# Altium schematic sheet Power_Supplies.SchDoc: =DocumentName
size A4; DocumentNumber: 1; Revision: 0; SheetNumber: 2; SheetTotal: 30
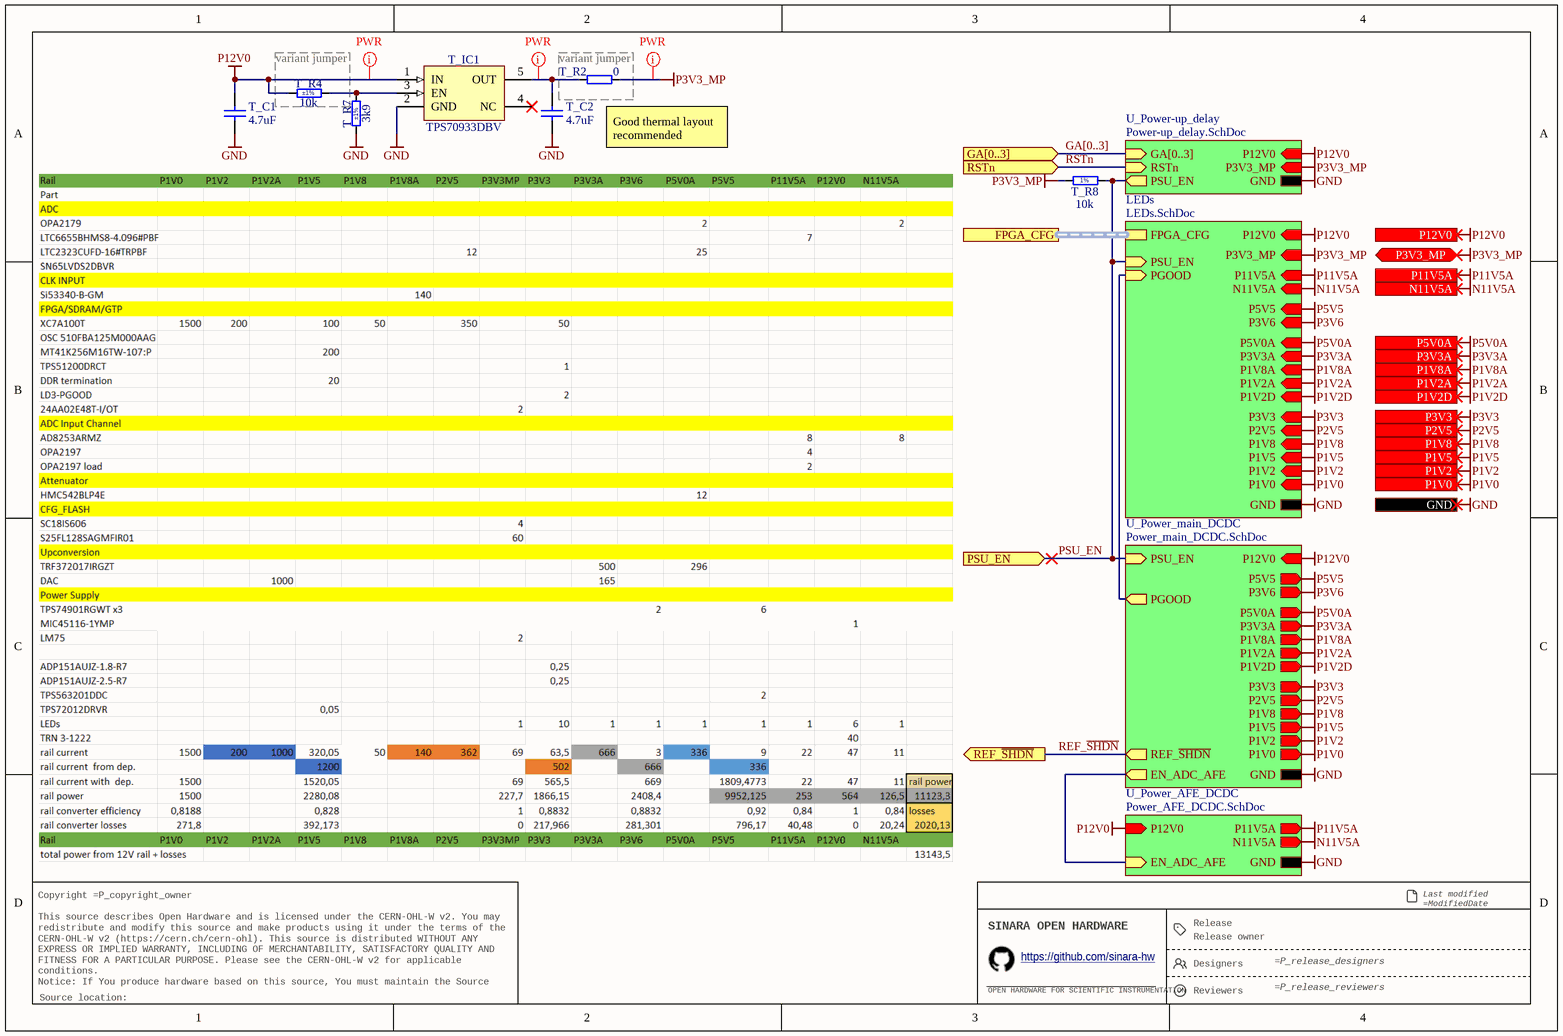
[diagram p0: Power_Supplies.SchDoc]

## Parts
T_C1  4.7uF  [CAPC2012X135N]
T_C2  4.7uF  [CAPC2012X135N]
T_IC1  TPS70933DBV  [SOT95P280X145-5N]
T_R2  0  [RESC1005X40N]
T_R4  10k  Tolerance: ±1%  [RESC1005X40N]
T_R7  3k9  Tolerance: ±1%  [RESC1005X40N]
T_R8  10k  [RESC1005X40N]

## Blocks framed on the sheet
variant jumper: T_R4
variant jumper: T_R2

## Sub-sheets
LEDs = LEDs.SchDoc: PSU_EN (in), PGOOD (in), P3V3_MP (in), P12V0 (in), FPGA_CFG (harness FPGA_CFG), P11V5A (in), N11V5A (in), GND, P5V0A (in), P3V3A (in), P1V8A (in), P1V2A (in), P1V2D (in), P3V3 (in), P2V5 (in), P1V8 (in), P1V5 (in), P1V2 (in), P1V0 (in), P5V5 (in), P3V6 (in)
U_Power-up_delay = Power-up_delay.SchDoc: GA[0..3] (in), RSTn (in), GND, PSU_EN (out), P3V3_MP (in), P12V0 (in)
U_Power_AFE_DCDC = Power_AFE_DCDC.SchDoc: P12V0 (in), P11V5A (out), GND, EN_ADC_AFE (in), N11V5A (out)
U_Power_main_DCDC = Power_main_DCDC.SchDoc: P12V0 (in), P5V0A (out), GND, PSU_EN (in), PGOOD (out), EN_ADC_AFE (out), REF_~{SHDN} (out), P3V3A (out), P1V8A (out), P1V2A (out), P1V2D (out), P3V3 (out), P2V5 (out), P1V8 (out), P1V5 (out), P1V2 (out), P1V0 (out), P5V5 (out), P3V6 (out)

## Ports
FPGA_CFG (harness FPGA_CFG), GA[0..3] (in), GND, N11V5A (out), P1V0 (out), P1V2 (out), P1V2A (out), P1V2D (out), P1V5 (out), P1V8 (out), P1V8A (out), P2V5 (out), P3V3 (out), P3V3_MP (bidir), P3V3A (out), P5V0A (out), P11V5A (out), P12V0 (in), PSU_EN (in), REF_~{SHDN} (out), RSTn (in)

## Nets
GND: T_C1.1 T_C2.1 T_IC1.2(GND) T_R7.1 ; port GND, sheet U_Power-up_delay/GND, sheet U_Power_main_DCDC/GND, sheet LEDs/GND, sheet U_Power_AFE_DCDC/GND
N11V5A: port N11V5A, sheet LEDs/N11V5A, sheet U_Power_AFE_DCDC/N11V5A
P1V0: port P1V0, sheet U_Power_main_DCDC/P1V0, sheet LEDs/P1V0
P1V2: port P1V2, sheet U_Power_main_DCDC/P1V2, sheet LEDs/P1V2
P1V2A: port P1V2A, sheet U_Power_main_DCDC/P1V2A, sheet LEDs/P1V2A
P1V2D: port P1V2D, sheet U_Power_main_DCDC/P1V2D, sheet LEDs/P1V2D
P1V5: port P1V5, sheet U_Power_main_DCDC/P1V5, sheet LEDs/P1V5
P1V8: port P1V8, sheet U_Power_main_DCDC/P1V8, sheet LEDs/P1V8
P1V8A: port P1V8A, sheet U_Power_main_DCDC/P1V8A, sheet LEDs/P1V8A
P2V5: port P2V5, sheet U_Power_main_DCDC/P2V5, sheet LEDs/P2V5
P3V3: port P3V3, sheet U_Power_main_DCDC/P3V3, sheet LEDs/P3V3
P3V3_MP: T_R2.2 T_R8.2 ; port P3V3_MP, sheet U_Power-up_delay/P3V3_MP, sheet LEDs/P3V3_MP
P3V3A: port P3V3A, sheet U_Power_main_DCDC/P3V3A, sheet LEDs/P3V3A
P3V6: sheet U_Power_main_DCDC/P3V6, sheet LEDs/P3V6
P5V0A: port P5V0A, sheet U_Power_main_DCDC/P5V0A, sheet LEDs/P5V0A
P5V5: sheet U_Power_main_DCDC/P5V5, sheet LEDs/P5V5
P11V5A: port P11V5A, sheet LEDs/P11V5A, sheet U_Power_AFE_DCDC/P11V5A
P12V0: T_C1.2 T_IC1.1(IN) T_R4.1 ; port P12V0, sheet U_Power-up_delay/P12V0, sheet U_Power_main_DCDC/P12V0, sheet LEDs/P12V0, sheet U_Power_AFE_DCDC/P12V0
PSU_EN: T_R8.1 ; port PSU_EN, sheet U_Power-up_delay/PSU_EN, sheet U_Power_main_DCDC/PSU_EN, sheet LEDs/PSU_EN
REF_~{SHDN}: port REF_~{SHDN}, sheet U_Power_main_DCDC/REF_~{SHDN}
RSTn: port RSTn, sheet U_Power-up_delay/RSTn
NetT_C2_2: T_C2.2 T_IC1.5(OUT) T_R2.1
NetT_IC1_3: T_IC1.3(EN) T_R4.2 T_R7.2
(unnamed): sheet U_Power_main_DCDC/PGOOD, sheet LEDs/PGOOD
(unnamed): sheet U_Power_main_DCDC/EN_ADC_AFE, sheet U_Power_AFE_DCDC/EN_ADC_AFE

Not connected (* = marked no-connect by the designer): T_IC1 4(NC)*

## Buses and harness runs
bus GA[0..3] = port GA[0..3] = sheet U_Power-up_delay/GA[0..3]
harness port FPGA_CFG = sheet LEDs/FPGA_CFG

## Layout directives
net class PWR: NetT_C2_2, P3V3_MP, P12V0

## Notes on the sheet
- (near T_R2) Good thermal layout recommended
- Release
- Last modified =ModifiedDate
  Sheet =sheetnumber of =sheettotal · Size A4
- Copyright =P_copyright_owner
  This source describes Open Hardware and is licensed under the CERN-OHL-W v2. You may redistribute and modify this source and make products using it under the terms of the CERN-OHL-W v2 (https://cern.ch/cern-ohl). This source is distributed WITHOUT ANY EXPRESS OR IMPLIED WARRANTY, INCLUDING OF MERCHANTABILITY, SATISFACTORY QUALITY AND FITNESS FOR A PARTICULAR PURPOSE. Please see the CERN-OHL-W v2 for applicable conditions.
  Notice: If You produce hardware based on this source, You must maintain the Source Location visible on the product, its packaging or its documentation.
- SINARA OPEN HARDWARE
- OPEN HARDWARE FOR SCIENTIFIC INSTRUMENTATION
- https://github.com/sinara-hw
- Release owner
- Designers
- Reviewers
- Source location:
- (in symbol R0402_10K_1%_0.0625W_100PPM) 1%

## Library data of the parts
T_C1 T_C2 = CC0805_4.7UF_16V_10%_X7R: Non-polarised capacitor; Part Description: SMD Multilayer Chip Ceramic Capacitor; Manufacturer: GENERIC; Manufacturer1 Part Number: EMK212B7475KG-T; Voltage: 16V; TC: X7R; Tolerance: ±10%; Part Number: CC0805_4.7UF_16V_10%_X7R; Component Kind: Standard; Component Type: Standard; Pin Count: 2; Value: 4.7uF; Status: Preferred; Manufacturer Part Number: CC0805_4.7UF_16V_10%_X7R; Case: 0805; Mounted: Yes; Socket: No; SMD: Yes; Sense: No; Manufacturer1 Example: TAIYO YUDEN; Manufacturer1 ComponentHeight: 1.35mm; HelpURL: \\cern.ch\dfs\Applications\Altium\Datasheets\CC0805_X7R_TAIYO-YUDEN_HIGH-VALUE.pdf; Author: CERN DEM JLC; CreateDate: 16.09.2014; LatestRevisionDate: 16.09.2014
T_IC1 = TPS70933DBV: 150-mA, 30-V, 1-µA IQ Voltage Regulators with Enable; Part Description: 3.3V, 150-mA, 30-V, 1-µA IQ Voltage Regulators with Enable; Manufacturer: TEXAS INSTRUMENTS; PressFit: No; Bonding: No; Part Number: TPS70933DBV; Component Kind: Standard; Component Type: Standard; Device: TPS70933DBV; PackageDescription: SOT23, 0.95mm Pitch; 5 Pin, 1.60mm W X 2.90mm L X 1.45mm H body, IPC Medium Density; Manufacturer Part Number: TPS70933DBV; Pin Count: 5; Case: SOT23-5; Mounted: Yes; Socket: No; SMD: Yes; Sense: No; ComponentHeight: 1.45mm; HelpURL: \\cern.ch\dfs\Applications\Altium\Datasheets\TPS709.pdf; Author: CERN DEM JLC; CreateDate: 17.03.2011; LatestRevisionDate: 17.03.2011
T_R2 = R0402_0R_JUMPER: Resistor; Part Description: 1A (0.05R Max DC Resistance) Zero Ohm Jumper; Manufacturer: GENERIC; Manufacturer1 Part Number: 232270591001L; PressFit: No; Part Number: R0402_0R_JUMPER; Component Kind: Standard; Component Type: Standard; Pin Count: 2; Value: 0; Status: Not Recommended; Manufacturer Part Number: R0402_0R_JUMPER; Case: 0402; Mounted: Yes; Sense: No; Socket: No; SMD: Yes; Manufacturer1 Example: YAGEO PHYCOMP; Manufacturer1 ComponentHeight: 0.4mm; HelpURL: \\cern.ch\dfs\Applications\Altium\Datasheets\R0402_Phycomp_RC0402.pdf; Author: CERN DEM JLC; CreateDate: 03.12.2007; LatestRevisionDate: 17.10.2012
T_R4 = R0402_10K_1%_0.0625W_100PPM: Resistor - 1%; Part Description: General Purpose Thick Film Chip Resistor; Manufacturer: GENERIC; Manufacturer1 Part Number: 232270671003L; TC: ±100ppm/°C; PressFit: No; Part Number: R0402_10K_1%_0.0625W_100PPM; Component Kind: Standard; Component Type: Standard; Pin Count: 2; Value: 10k; Status: Not Recommended; Power: 0.0625W; Manufacturer Part Number: R0402_10K_1%_0.0625W_100PPM; Case: 0402; Mounted: Yes; Sense: No; Socket: No; SMD: Yes; Manufacturer1 Example: YAGEO PHYCOMP; Manufacturer1 ComponentHeight: 0.4mm; HelpURL: \\cern.ch\dfs\Applications\Altium\Datasheets\R0402_Phycomp_RC0402.pdf; Author: CERN DEM JLC; CreateDate: 03.12.2007; LatestRevisionDate: 17.10.2012
T_R7 = R0402_3K9_1%_0.0625W_100PPM: Resistor - 1%; Part Description: General Purpose Thick Film Chip Resistor; Manufacturer: GENERIC; Manufacturer1 Part Number: 232270673902L; TC: ±100ppm/°C; PressFit: No; Part Number: R0402_3K9_1%_0.0625W_100PPM; Component Kind: Standard; Component Type: Standard; Pin Count: 2; Value: 3k9; Status: Not Recommended; Power: 0.0625W; Manufacturer Part Number: R0402_3K9_1%_0.0625W_100PPM; Case: 0402; Mounted: Yes; Sense: No; Socket: No; SMD: Yes; Manufacturer1 Example: YAGEO PHYCOMP; Manufacturer1 ComponentHeight: 0.4mm; HelpURL: \\cern.ch\dfs\Applications\Altium\Datasheets\R0402_Phycomp_RC0402.pdf; Author: CERN DEM JLC; CreateDate: 03.12.2007; LatestRevisionDate: 17.10.2012
T_R8 = R0402_10K_1%_0.0625W_100PPM: Resistor - 1%; Part Description: General Purpose Thick Film Chip Resistor; Manufacturer: GENERIC; Manufacturer1 Part Number: 232270671003L; TC: ±100ppm/°C; Part Number: R0402_10K_1%_0.0625W_100PPM; Component Kind: Standard; Component Type: Standard; Pin Count: 2; Value: 10k; Status: Not recommended; Power: 0.0625W; Tolerance: ±1%; Manufacturer Part Number: R0402_10K_1%_0.0625W_100PPM; Case: 0402; Mounted: Yes; Sense: No; Socket: No; SMD: Yes; Manufacturer1 Example: YAGEO PHYCOMP; Manufacturer1 ComponentHeight: 0.4mm; HelpURL: \\cern.ch\dfs\Applications\Altium\Datasheets\R0402_Phycomp_RC0402.pdf; Author: CERN DEM JLC; CreateDate: 03.12.2007; LatestRevisionDate: 17.10.2012